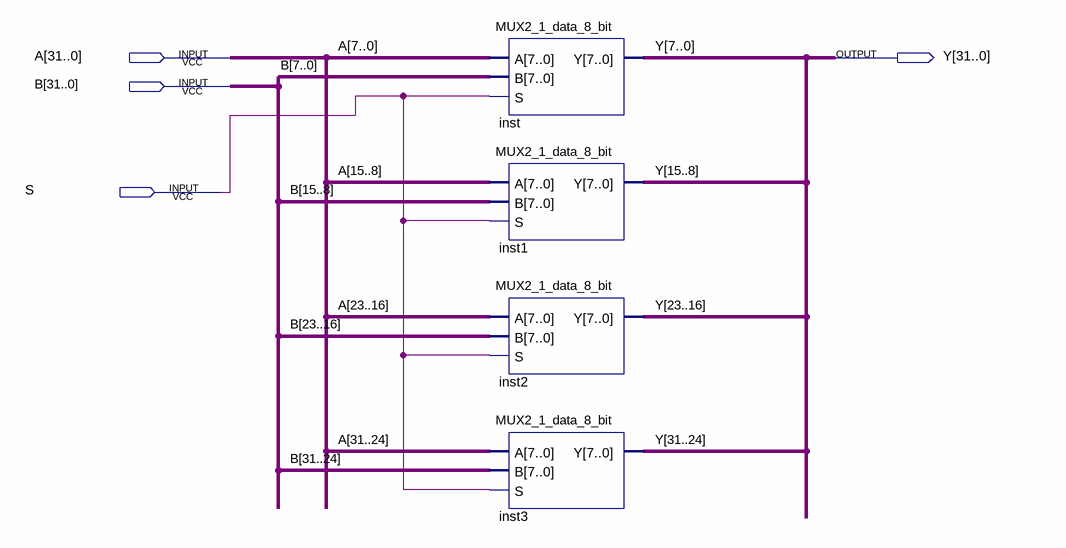
[diagram p0: schematic sheet]
// Quartus schematic MUX2_1_data_32_bit.bdf as structural Verilog: 4 symbols, 4 pins
module MUX2_1_data_32_bit (
  input  [31:0] A,
  input  [31:0] B,
  input  S,
  output [31:0] Y
);

  MUX2_1_data_8_bit inst (.A(A[7:0]), .B(B[7:0]), .S(S), .Y(Y[7:0]));
  MUX2_1_data_8_bit inst1 (.A(A[15:8]), .B(B[15:8]), .S(S), .Y(Y[15:8]));
  MUX2_1_data_8_bit inst2 (.A(A[23:16]), .B(B[23:16]), .S(S), .Y(Y[23:16]));
  MUX2_1_data_8_bit inst3 (.A(A[31:24]), .B(B[31:24]), .S(S), .Y(Y[31:24]));
endmodule
